# Altium schematic sheet starfish_1.SchDoc: starfish
size 409 x 289 mm; Origin: Eagle; Date: 4/18/2022 11:53:22 PM; SheetNumber: 2; GateName_1: G$1; SymbolName_1: A3L-LOC; LibraryName: frames; DeviceSetName: A3L-LOC; Sheet: Sheet:
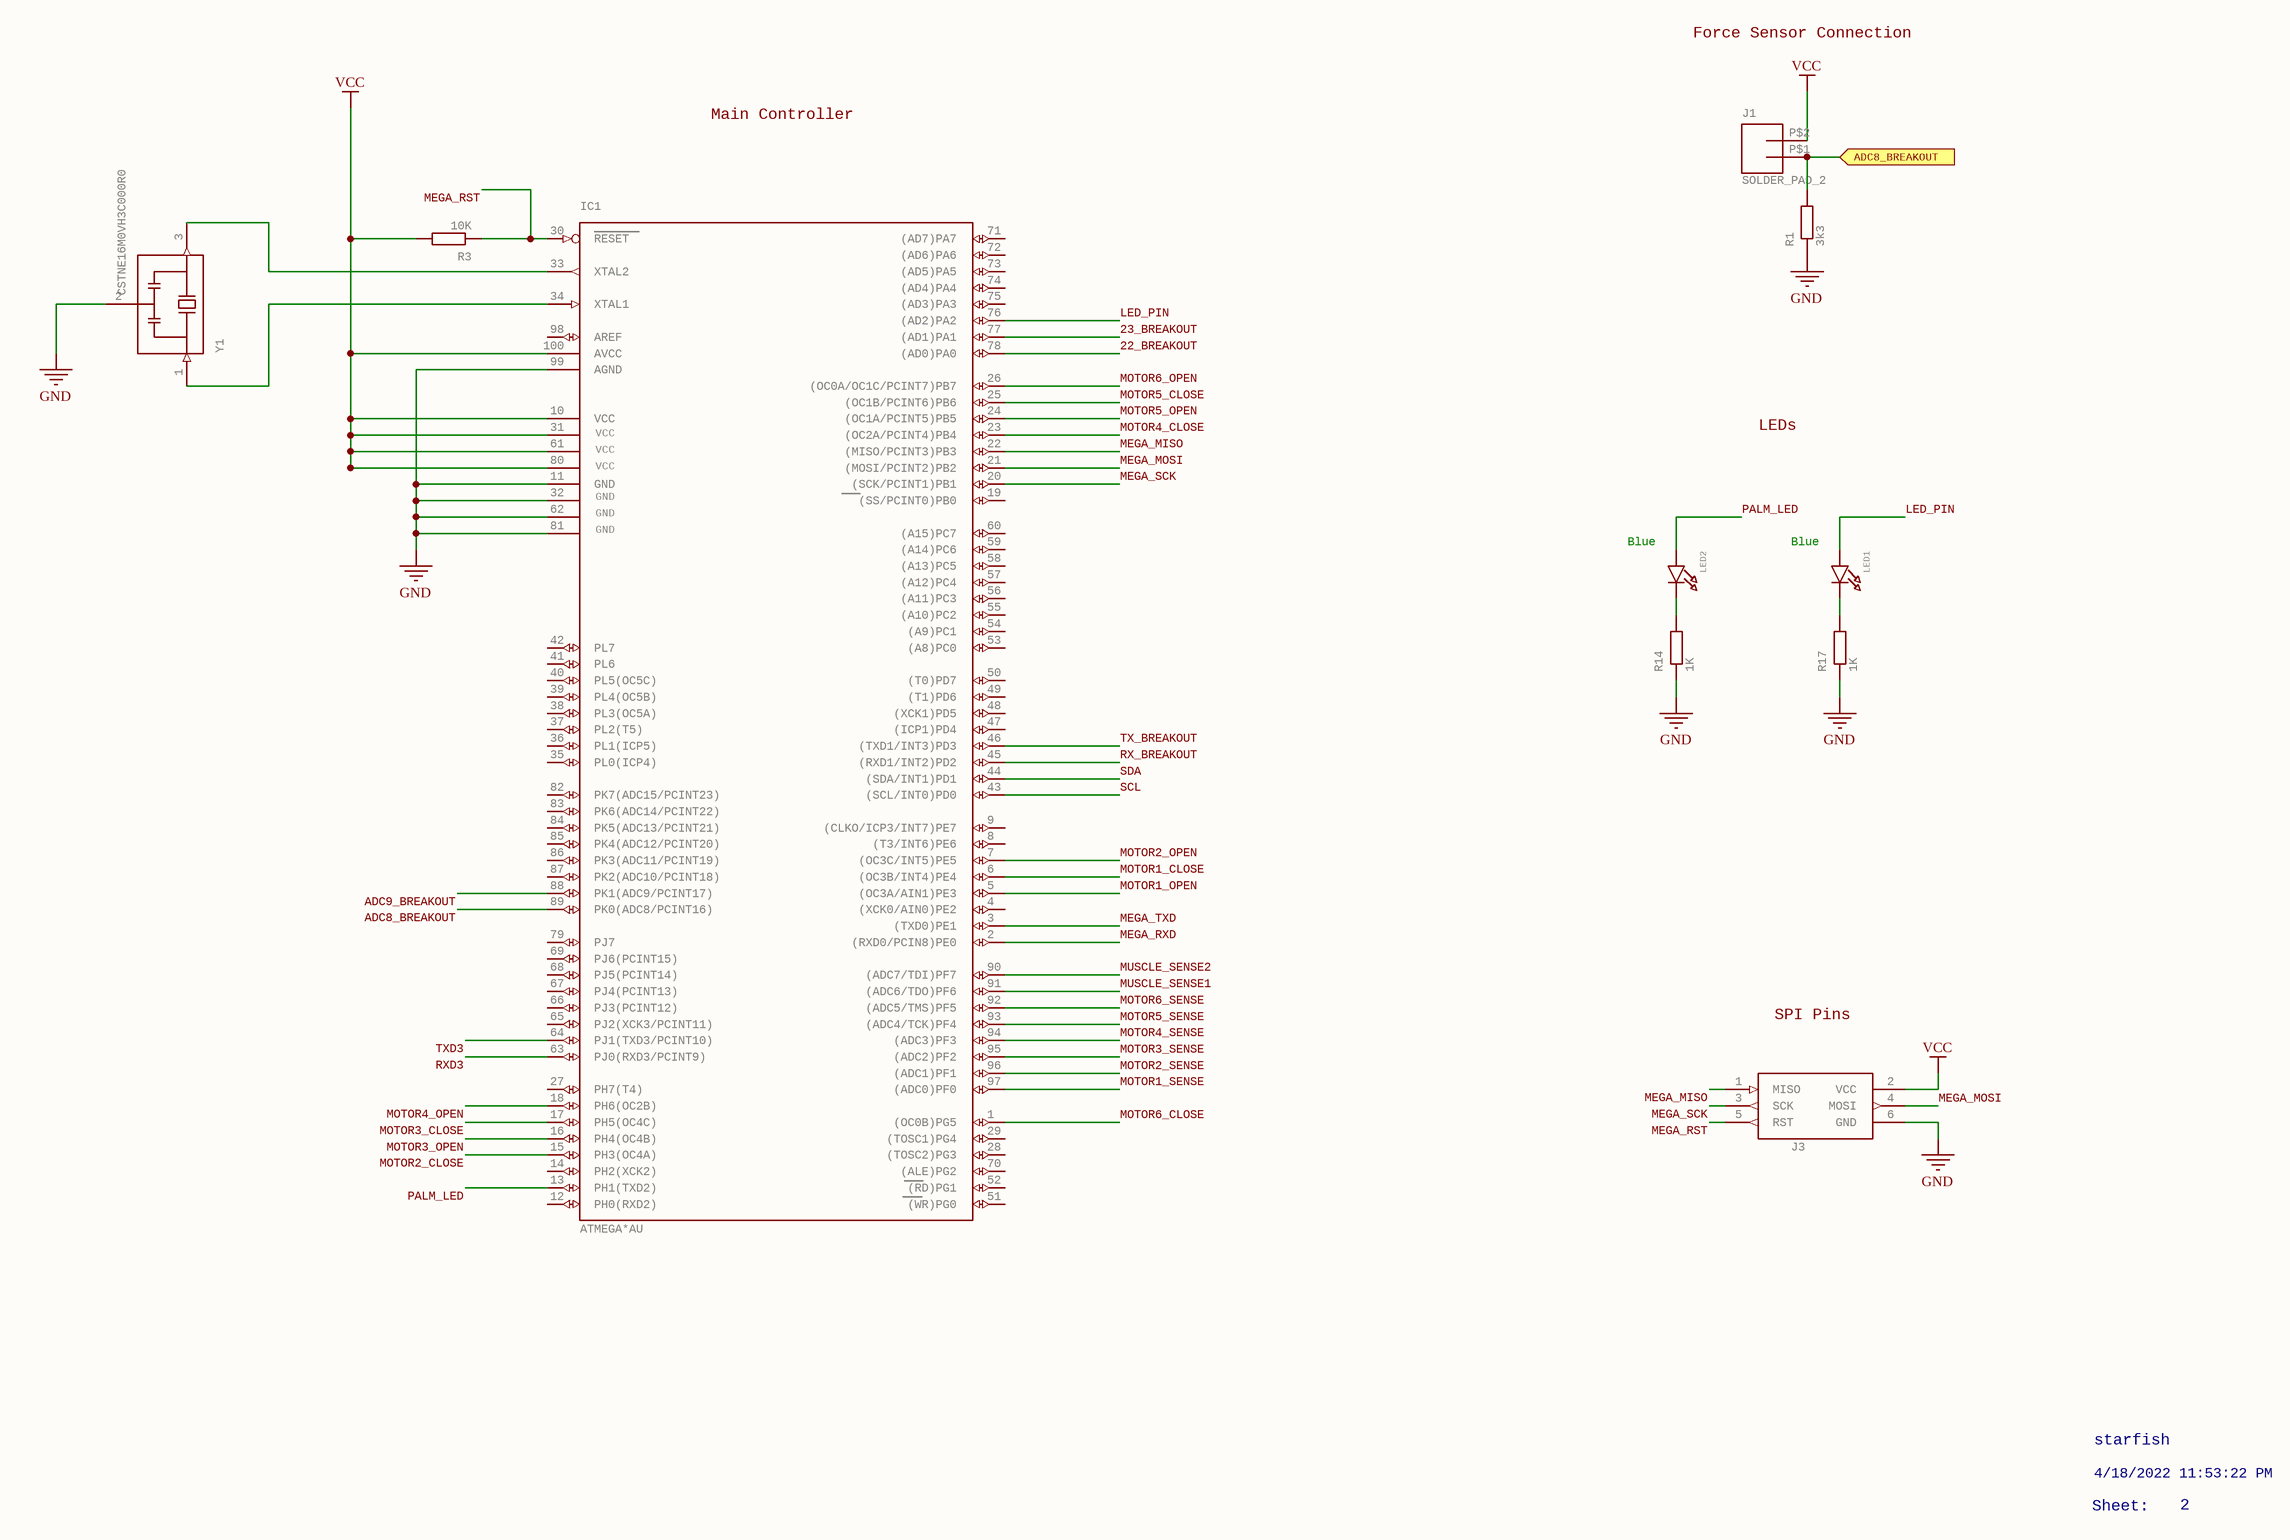
[diagram p0: starfish_1.SchDoc]

## Parts
IC1  ATMEGA*AU  [TQFP100]
J1  SOLDER_PAD_2  [SOLDER_PAD_2]
J3  DNF  [AVRISP]  (value not drawn)
LED1  LED0805  [CHIPLED_0805]  (value not drawn)
LED2  LED0805  [CHIPLED_0805]  (value not drawn)
R1  3k3  [R0603]
R3  10K  [R0603]
R14  1K  [R0603]
R17  1K  [R0603]
Y1  CSTNE16M0VH3C000R0  [OSC_CSTNE16M0VH3C000R0]

## Ports
ADC8_BREAKOUT (in)

## Nets
GND: IC1.11(GND) IC1.32(GND1) IC1.62(GND2) IC1.81(GND3) IC1.99(AGND) J3.6(GND) R1.1 R14.1 R17.1 Y1.2(GND)
VCC: IC1.10(VCC) IC1.31(VCC1) IC1.61(VCC2) IC1.80(VCC3) IC1.100(AVCC) J1.P$2 J3.2(VCC) R3.2
22_BREAKOUT: IC1.78((AD0)PA0)
23_BREAKOUT: IC1.77((AD1)PA1)
ADC8_BREAKOUT: IC1.89(PK0(ADC8/PCINT16))
ADC8_BREAKOUT: J1.P$1 R1.2 ; port ADC8_BREAKOUT  [a separate net that carries the same name]
ADC9_BREAKOUT: IC1.88(PK1(ADC9/PCINT17))
LED_PIN: IC1.76((AD2)PA2) LED1.A
MEGA_MISO: IC1.22((MISO/PCINT3)PB3) J3.1(MISO)
MEGA_MOSI: IC1.21((MOSI/PCINT2)PB2) J3.4(MOSI)
MEGA_RST: IC1.30(RESET) J3.5(RST) R3.1
MEGA_RXD: IC1.2((RXD0/PCIN8)PE0)
MEGA_SCK: IC1.20((SCK/PCINT1)PB1) J3.3(SCK)
MEGA_TXD: IC1.3((TXD0)PE1)
MOTOR1_CLOSE: IC1.6((OC3B/INT4)PE4)
MOTOR1_OPEN: IC1.5((OC3A/AIN1)PE3)
MOTOR1_SENSE: IC1.97((ADC0)PF0)
MOTOR2_CLOSE: IC1.15(PH3(OC4A))
MOTOR2_OPEN: IC1.7((OC3C/INT5)PE5)
MOTOR2_SENSE: IC1.96((ADC1)PF1)
MOTOR3_CLOSE: IC1.17(PH5(OC4C))
MOTOR3_OPEN: IC1.16(PH4(OC4B))
MOTOR3_SENSE: IC1.95((ADC2)PF2)
MOTOR4_CLOSE: IC1.23((OC2A/PCINT4)PB4)
MOTOR4_OPEN: IC1.18(PH6(OC2B))
MOTOR4_SENSE: IC1.94((ADC3)PF3)
MOTOR5_CLOSE: IC1.25((OC1B/PCINT6)PB6)
MOTOR5_OPEN: IC1.24((OC1A/PCINT5)PB5)
MOTOR5_SENSE: IC1.93((ADC4/TCK)PF4)
MOTOR6_CLOSE: IC1.1((OC0B)PG5)
MOTOR6_OPEN: IC1.26((OC0A/OC1C/PCINT7)PB7)
MOTOR6_SENSE: IC1.92((ADC5/TMS)PF5)
MUSCLE_SENSE1: IC1.91((ADC6/TDO)PF6)
MUSCLE_SENSE2: IC1.90((ADC7/TDI)PF7)
PALM_LED: IC1.13(PH1(TXD2)) LED2.A
RX_BREAKOUT: IC1.45((RXD1/INT2)PD2)
RXD3: IC1.63(PJ0(RXD3/PCINT9))
SCL: IC1.43((SCL/INT0)PD0)
SDA: IC1.44((SDA/INT1)PD1)
TX_BREAKOUT: IC1.46((TXD1/INT3)PD3)
TXD3: IC1.64(PJ1(TXD3/PCINT10))
NetIC1_33: IC1.33(XTAL2) Y1.3(OUT)
NetIC1_34: IC1.34(XTAL1) Y1.1(IN)
NetLED1_C: LED1.C R17.2
NetLED2_C: LED2.C R14.2

Not connected (* = marked no-connect by the designer): IC1 4((XCK0/AIN0)PE2) 8((T3/INT6)PE6) 9((CLKO/ICP3/INT7)PE7) 12(PH0(RXD2)) 14(PH2(XCK2)) 19((SS/PCINT0)PB0) 27(PH7(T4)) 28((TOSC2)PG3) 29((TOSC1)PG4) 35(PL0(ICP4)) 36(PL1(ICP5)) 37(PL2(T5)) 38(PL3(OC5A)) 39(PL4(OC5B)) 40(PL5(OC5C)) 41(PL6) 42(PL7) 47((ICP1)PD4) 48((XCK1)PD5) 49((T1)PD6) 50((T0)PD7) 51((WR)PG0) 52((RD)PG1) 53((A8)PC0) 54((A9)PC1) 55((A10)PC2) 56((A11)PC3) 57((A12)PC4) 58((A13)PC5) 59((A14)PC6) 60((A15)PC7) 65(PJ2(XCK3/PCINT11)) 66(PJ3(PCINT12)) 67(PJ4(PCINT13)) 68(PJ5(PCINT14)) 69(PJ6(PCINT15)) 70((ALE)PG2) 71((AD7)PA7) 72((AD6)PA6) 73((AD5)PA5) 74((AD4)PA4) 75((AD3)PA3) 79(PJ7) 82(PK7(ADC15/PCINT23)) 83(PK6(ADC14/PCINT22)) 84(PK5(ADC13/PCINT21)) 85(PK4(ADC12/PCINT20)) 86(PK3(ADC11/PCINT19)) 87(PK2(ADC10/PCINT18)) 98(AREF)

## Notes on the sheet
- Force Sensor Connection
- Main Controller
- LEDs
- (near LED2) Blue
- (near LED1) Blue
- SPI Pins
- starfish
- Sheet:
- 4/18/2022 11:53:22 PM
- 2

## Library data of the parts
IC1 = ATMEGA*AU: MICROCONTROLLER   64/128/256 Kbytes FLASH   4 Kbytes EEPROM   8 Kbytes SRAM   86 General Purpose I/O pins   12-channels16-bit PWM   4 x Serial USARTs   16-channels 10-bit A/D; GateName_1: 1; SymbolName_1: 86-I/O-1; DeviceName: AU; LibraryName: atmel-2005; DeviceSetName: ATMEGA*; GND: GND; VCC: VCC
J1 = SOLDER_PAD_2: Solder Pad for LuMini Rings; GateName_1: G$1; SymbolName_1: CONN_02; LibraryName: SparkFun-Connectors; DeviceSetName: SOLDER_PAD_2
J3 = AVRISP-6: AVR ISP HEADER Standard 6 pin header for AVR programming; GateName_1: G$1; DeviceName: -6; SymbolName_1: AVRISP; LibraryName: adafruit; DeviceSetName: AVRISP
LED1 LED2 = LED0805: LED0603 - 0603 Surface Mount Package    2mA: Green LED - Low Power (3.9mcd, 2ma, 1.7Vf) - Digikey: 475-2709-2-ND  Orange LED - Low Power (9.8mcd, 2ma, 1.8Vf) - Digikey: 475-1194-2-ND  Red LED - Low Power (5mcd, 2ma, 1.8Vf) - Digikey: 475-1195-2-ND  Yellow LED - Low Power (7mcd, 2ma, 1.8Vf) - Digikey: 475-1196-2-ND       5mA: Blue LED - Low Power (17mcd, 5ma, 2.9Vf) - Digikey: LNJ937W8CRACT-ND    0805 - 0805 Surface Mount Package    2mA: Red LED (8.8mcd, 2mA, 1.8Vf, Clear) - Low Power [Digikey: 475-2510-1-ND]  Green LED (5mcd, 2mA, 1.8Vf, Clear) - Low Power [Digikey: 475-2730-1-ND]  Yellow LED (11.3mcd, 2mA, 1.8Vf, Clear) - Low Power [Digikey: 475-2555-1-ND]       20mA: Red LED (104mcd, 20mA, Diffused) - LS R976 [Digikey: 475-1278-6-ND]  Red LED (12mcd, 20mA, 2.0Vf, Clear) - APT2012EC [Digikey: 754-1128-1-ND]  Green LED (15mcd, 20mA, 2.2Vf, Clear) - APT2012GC [Digikey: 754-1131-1-ND]  Orange LED (160mcd, 20mA, 2.1Vf, Clear) - APT2012SECK [Digikey: 754-1130-1-ND]     1206 - 1206 Surface Mount Package  Green LED (26mcd, 20mA, Diffused) - LG N971  [Digikey: 475-1407-6-ND]  Red LED (15mcd, 20mA, Diffused) - LH N974 [Digikey: 475-1416-6-ND]; GateName_1: G$1; DeviceName: 0805; SymbolName_1: LED; LibraryName: microbuilder; DeviceSetName: LED
R1 R3 R14 R17 = R-EU_R0603: RESISTOR, European symbol; GateName_1: G$1; SymbolName_1: R-EU; DeviceSetName: R-EU_; DeviceName: R0603; LibraryName: resistor
Y1 = CSTNE16M0VH3C000R0: 16MHz Ceramic Resonator Built in Capacitor 15pF Â±0.15% 40 Ohms -40Â°C ~ 125Â°C Surface Mount  Check availability; GateName_1: G$1; DESCRIPTION: 16 MHz Ceramic Resonator Built in Capacitor 15 pF ±0.13% 40 Ohms -40°C ~ 125°C Surface Mount; MF: Murata Electronics North America; SymbolName_1: CSTNE16M0VH3C000R0; LibraryName: CSTNE16M0VH3C000R0; DeviceSetName: CSTNE16M0VH3C000R0; AVAILABILITY: In Stock; MP: CSTNE16M0VH3C000R0; PACKAGE: SMD-3 Murata; PRICE: None; PURCHASE-URL: https://pricing.snapeda.com/search/part/CSTNE16M0VH3C000R0/?ref=eda